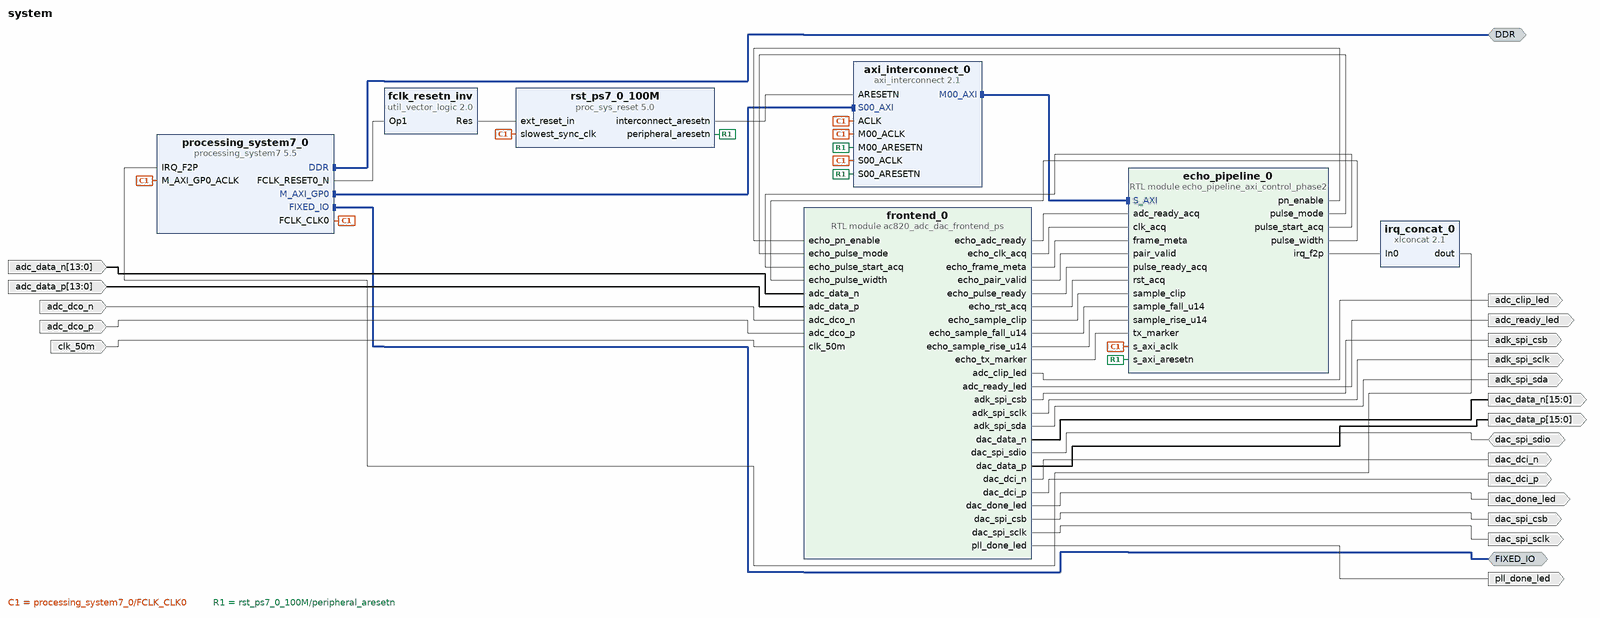
[diagram p0: block diagram of the top level]
# Vivado block design system, xc7z020clg484-2, Vivado 2026.1
create_bd_design system

create_bd_intf_port -mode Master -vlnv xilinx.com:interface:ddrx_rtl:1.0 DDR
create_bd_intf_port -mode Master -vlnv xilinx.com:display_processing_system7:fixedio_rtl:1.0 FIXED_IO
create_bd_port -dir I -type clk clk_50m
set_property -dict {CONFIG.FREQ_HZ 50000000} [get_bd_ports clk_50m]
create_bd_port -dir I -type clk adc_dco_p
set_property -dict {CONFIG.FREQ_HZ 100000000} [get_bd_ports adc_dco_p]
create_bd_port -dir I adc_dco_n
create_bd_port -dir I -from 13 -to 0 adc_data_p
create_bd_port -dir I -from 13 -to 0 adc_data_n
create_bd_port -dir O adk_spi_sda
create_bd_port -dir O adk_spi_sclk
create_bd_port -dir O adk_spi_csb
create_bd_port -dir IO dac_spi_sdio
create_bd_port -dir O dac_spi_sclk
create_bd_port -dir O dac_spi_csb
create_bd_port -dir O dac_dci_p
create_bd_port -dir O dac_dci_n
create_bd_port -dir O -from 15 -to 0 dac_data_p
create_bd_port -dir O -from 15 -to 0 dac_data_n
create_bd_port -dir O pll_done_led
create_bd_port -dir O dac_done_led
create_bd_port -dir O adc_ready_led
create_bd_port -dir O adc_clip_led

create_bd_cell -type ip -vlnv xilinx.com:ip:processing_system7:5.5 processing_system7_0
set_property -dict [list \
  CONFIG.PCW_FPGA0_PERIPHERAL_FREQMHZ 100.000000 \
  CONFIG.PCW_GPIO_MIO_GPIO_ENABLE 1 \
  CONFIG.PCW_GPIO_MIO_GPIO_IO MIO \
  CONFIG.PCW_I2C_RESET_ENABLE 0 \
  CONFIG.PCW_IRQ_F2P_INTR 1 \
  CONFIG.PCW_PRESET_BANK1_VOLTAGE {LVCMOS 1.8V} \
  CONFIG.PCW_SD0_GRP_CD_ENABLE 0 \
  CONFIG.PCW_SD0_GRP_WP_ENABLE 0 \
  CONFIG.PCW_SD0_PERIPHERAL_ENABLE 1 \
  CONFIG.PCW_SD0_SD0_IO {MIO 40 .. 45} \
  CONFIG.PCW_SDIO_PERIPHERAL_FREQMHZ 100 \
  CONFIG.PCW_UART0_PERIPHERAL_ENABLE 1 \
  CONFIG.PCW_UART0_UART0_IO {MIO 10 .. 11} \
  CONFIG.PCW_UART1_PERIPHERAL_ENABLE 1 \
  CONFIG.PCW_UART1_UART1_IO {MIO 48 .. 49} \
  CONFIG.PCW_UART_PERIPHERAL_FREQMHZ 100 \
  CONFIG.PCW_UIPARAM_DDR_FREQ_MHZ 533.333333 \
  CONFIG.PCW_UIPARAM_DDR_PARTNO {MT41J256M16 RE-125} \
  CONFIG.PCW_USB_RESET_ENABLE 0 \
  CONFIG.PCW_USE_FABRIC_INTERRUPT 1 \
] [get_bd_cells processing_system7_0]
# 222 more settings of processing_system7_0 are not shown: defaults, MIO pin electricals, DDR timing, and values the tool derives
create_bd_cell -type ip -vlnv xilinx.com:ip:axi_interconnect:2.1 axi_interconnect_0
set_property -dict {CONFIG.NUM_MI 1 CONFIG.NUM_SI 1} [get_bd_cells axi_interconnect_0]
create_bd_cell -type ip -vlnv xilinx.com:ip:proc_sys_reset:5.0 rst_ps7_0_100M
create_bd_cell -type ip -vlnv xilinx.com:ip:util_vector_logic:2.0 fclk_resetn_inv
set_property -dict {CONFIG.C_OPERATION not CONFIG.C_SIZE 1} [get_bd_cells fclk_resetn_inv]
create_bd_cell -type ip -vlnv xilinx.com:ip:xlconcat:2.1 irq_concat_0
set_property -dict {CONFIG.NUM_PORTS 1} [get_bd_cells irq_concat_0]
create_bd_cell -type module -reference ac820_adc_dac_frontend_ps frontend_0
create_bd_cell -type module -reference echo_pipeline_axi_control_phase2 echo_pipeline_0

# ---- connections ----

connect_bd_intf_net [get_bd_intf_pins axi_interconnect_0/M00_AXI] [get_bd_intf_pins echo_pipeline_0/S_AXI]
connect_bd_intf_net [get_bd_intf_ports DDR] [get_bd_intf_pins processing_system7_0/DDR]
connect_bd_intf_net [get_bd_intf_ports FIXED_IO] [get_bd_intf_pins processing_system7_0/FIXED_IO]
connect_bd_intf_net [get_bd_intf_pins processing_system7_0/M_AXI_GP0] [get_bd_intf_pins axi_interconnect_0/S00_AXI]
connect_bd_net [get_bd_ports dac_spi_sdio] [get_bd_pins frontend_0/dac_spi_sdio]
connect_bd_net [get_bd_ports adc_data_n] [get_bd_pins frontend_0/adc_data_n]
connect_bd_net [get_bd_ports adc_data_p] [get_bd_pins frontend_0/adc_data_p]
connect_bd_net [get_bd_ports adc_dco_n] [get_bd_pins frontend_0/adc_dco_n]
connect_bd_net [get_bd_ports adc_dco_p] [get_bd_pins frontend_0/adc_dco_p]
connect_bd_net [get_bd_ports clk_50m] [get_bd_pins frontend_0/clk_50m]
connect_bd_net [get_bd_pins echo_pipeline_0/irq_f2p] [get_bd_pins irq_concat_0/In0]
connect_bd_net [get_bd_pins echo_pipeline_0/pn_enable] [get_bd_pins frontend_0/echo_pn_enable]
connect_bd_net [get_bd_pins echo_pipeline_0/pulse_mode] [get_bd_pins frontend_0/echo_pulse_mode]
connect_bd_net [get_bd_pins echo_pipeline_0/pulse_start_acq] [get_bd_pins frontend_0/echo_pulse_start_acq]
connect_bd_net [get_bd_pins echo_pipeline_0/pulse_width] [get_bd_pins frontend_0/echo_pulse_width]
connect_bd_net [get_bd_pins fclk_resetn_inv/Res] [get_bd_pins rst_ps7_0_100M/ext_reset_in]
connect_bd_net [get_bd_pins frontend_0/adc_clip_led] [get_bd_ports adc_clip_led]
connect_bd_net [get_bd_pins frontend_0/adc_ready_led] [get_bd_ports adc_ready_led]
connect_bd_net [get_bd_pins frontend_0/adk_spi_csb] [get_bd_ports adk_spi_csb]
connect_bd_net [get_bd_pins frontend_0/adk_spi_sclk] [get_bd_ports adk_spi_sclk]
connect_bd_net [get_bd_pins frontend_0/adk_spi_sda] [get_bd_ports adk_spi_sda]
connect_bd_net [get_bd_pins frontend_0/dac_data_n] [get_bd_ports dac_data_n]
connect_bd_net [get_bd_pins frontend_0/dac_data_p] [get_bd_ports dac_data_p]
connect_bd_net [get_bd_pins frontend_0/dac_dci_n] [get_bd_ports dac_dci_n]
connect_bd_net [get_bd_pins frontend_0/dac_dci_p] [get_bd_ports dac_dci_p]
connect_bd_net [get_bd_pins frontend_0/dac_done_led] [get_bd_ports dac_done_led]
connect_bd_net [get_bd_pins frontend_0/dac_spi_csb] [get_bd_ports dac_spi_csb]
connect_bd_net [get_bd_pins frontend_0/dac_spi_sclk] [get_bd_ports dac_spi_sclk]
connect_bd_net [get_bd_pins frontend_0/echo_adc_ready] [get_bd_pins echo_pipeline_0/adc_ready_acq]
connect_bd_net [get_bd_pins frontend_0/echo_clk_acq] [get_bd_pins echo_pipeline_0/clk_acq]
connect_bd_net [get_bd_pins frontend_0/echo_frame_meta] [get_bd_pins echo_pipeline_0/frame_meta]
connect_bd_net [get_bd_pins frontend_0/echo_pair_valid] [get_bd_pins echo_pipeline_0/pair_valid]
connect_bd_net [get_bd_pins frontend_0/echo_pulse_ready] [get_bd_pins echo_pipeline_0/pulse_ready_acq]
connect_bd_net [get_bd_pins frontend_0/echo_rst_acq] [get_bd_pins echo_pipeline_0/rst_acq]
connect_bd_net [get_bd_pins frontend_0/echo_sample_clip] [get_bd_pins echo_pipeline_0/sample_clip]
connect_bd_net [get_bd_pins frontend_0/echo_sample_fall_u14] [get_bd_pins echo_pipeline_0/sample_fall_u14]
connect_bd_net [get_bd_pins frontend_0/echo_sample_rise_u14] [get_bd_pins echo_pipeline_0/sample_rise_u14]
connect_bd_net [get_bd_pins frontend_0/echo_tx_marker] [get_bd_pins echo_pipeline_0/tx_marker]
connect_bd_net [get_bd_pins frontend_0/pll_done_led] [get_bd_ports pll_done_led]
connect_bd_net [get_bd_pins irq_concat_0/dout] [get_bd_pins processing_system7_0/IRQ_F2P]
connect_bd_net [get_bd_pins processing_system7_0/FCLK_CLK0] \
  [get_bd_pins processing_system7_0/M_AXI_GP0_ACLK] [get_bd_pins axi_interconnect_0/ACLK] \
  [get_bd_pins axi_interconnect_0/S00_ACLK] [get_bd_pins axi_interconnect_0/M00_ACLK] \
  [get_bd_pins rst_ps7_0_100M/slowest_sync_clk] [get_bd_pins echo_pipeline_0/s_axi_aclk]
connect_bd_net [get_bd_pins processing_system7_0/FCLK_RESET0_N] [get_bd_pins fclk_resetn_inv/Op1]
connect_bd_net [get_bd_pins rst_ps7_0_100M/interconnect_aresetn] [get_bd_pins axi_interconnect_0/ARESETN]
connect_bd_net [get_bd_pins rst_ps7_0_100M/peripheral_aresetn] \
  [get_bd_pins axi_interconnect_0/S00_ARESETN] [get_bd_pins axi_interconnect_0/M00_ARESETN] \
  [get_bd_pins echo_pipeline_0/s_axi_aresetn]

# ---- address map ----
assign_bd_address -offset 0x43C00000 -range 64K -target_address_space [get_bd_addr_spaces processing_system7_0/Data] [get_bd_addr_segs echo_pipeline_0/S_AXI/reg0]

validate_bd_design
save_bd_design
